# Altium schematic sheet Detection_Circuit.SchDoc
size 114 x 127 mm; SheetNumber: 2; SheetTotal: 3
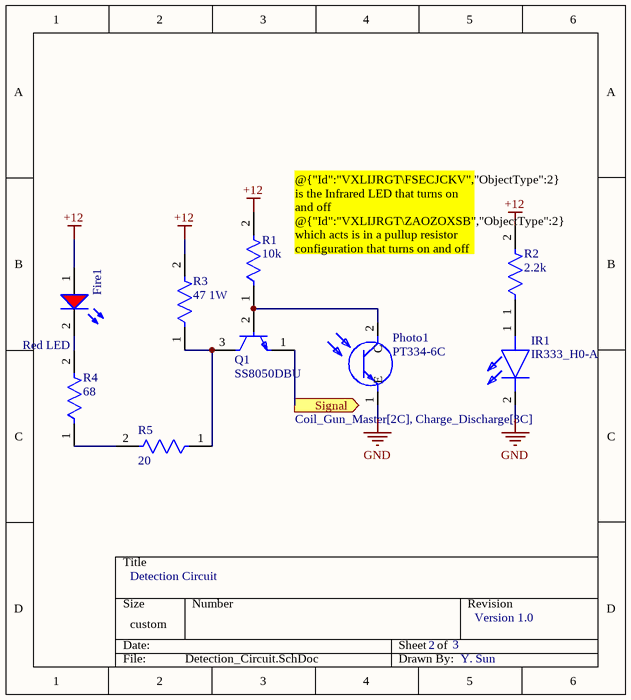
[diagram p0: Detection_Circuit.SchDoc]

## Parts
Fire1  Red LED  [WL-TMRC_D5.9H8.7]
IR1  IR333_H0-A  [IR333H0A]
Photo1  PT334-6C  [PT3346C]
Q1  SS8050DBU  [FP-135AN-MFG]
R1  10k  [FP-CFR16-MFG]
R2  2.2k  [FP-CFR16-MFG]
R3  47 1W  [FP-RR01-MFG]
R4  68  [FP-CFR16-MFG]
R5  20  [FP-CFR16-MFG]

## Ports
Signal (out, see Coil_Gun_Master[2C], Charge_Discharge[3C])

## Nets
+12: Fire1.1(A) R1.2 R2.2 R3.2
GND: IR1.2(K) Photo1.1(E)
Signal: Q1.1(E) ; port Signal
NetFire1_2: Fire1.2(K) R4.2
NetIR1_1: IR1.1(A) R2.1
NetPhoto1_2: Photo1.2(C) Q1.2(B) R1.1
NetQ1_3: Q1.3(C) R3.1 R5.1
NetR4_1: R4.1 R5.2

## Notes on the sheet
- @{"Id":"VXLIJRGT\FSECJCKV","ObjectType":2} is the Infrared LED that turns on and off @{"Id":"VXLIJRGT\ZAOZOXSB","ObjectType":2} which acts is in a pullup resistor configuration that turns on and off the transistor that controls the Thrysistor
- Detection Circuit
- 2
- 3
- Version 1.0
- Y. Sun

## Library data of the parts
Fire1 = CMP-1488-00008-3: WL-TMRC Red Color Diffused 5 mm Round Through Hole LED; Manufacturer Lifecycle Status: ACTIVE; Forward Voltage: 2.1V; YEOL: 1 = Estimated lifetime > 10 years; Lens Size: 5mm; Lens Style: Circular, Diffused, Round; Luminous Intensity: 30mcd; Test Current: 20mA; Viewing Angle: 60°; Wavelength: 630nm; Max Reverse Voltage (DC): 5V; Forward Current: 100mA; Dominant Wavelength: 645nm; Peak Wavelength: 650nm; Height: 8.6mm; REACH SVHC: Unknown; Width: 5mm; RoHS: Compliant; Mount: Through Hole; Case/Package: Radial; Min Operating Temperature: -40°C; Length: 5mm; Max Operating Temperature: 85°C; Packaging: Bulk; Color: Red; Lifecycle Status: Production
IR1 = IR333_H0-A: LED; Manufacturer_Name: Everlight; Manufacturer_Part_Number: IR333/H0-A; Datasheet Link: https://datasheet.lcsc.com/lcsc/1808280419_Everlight-Elec-IR333-H0-A_C264292.pdf; Height: 10.4mm; Mouser Part Number: 638-IR333/H0-A; Mouser Price/Stock: https://www.mouser.co.uk/ProductDetail/Everlight/IR333-H0-A?qs=By6Nw2ByBD39%252BlkBkN%2FobQ%3D%3D
Photo1 = PT334-6C: Phototransistor; Manufacturer_Name: Everlight; Datasheet Link: https://ar.mouser.com/datasheet/2/143/EVER_S_A0003541250_1-2548712.pdf; Height: 10.4mm; Manufacturer_Part_Number: PT334-6C; Mouser Part Number: 638-PT334-6C; Mouser Price/Stock: https://www.mouser.co.uk/ProductDetail/Everlight/PT334-6C?qs=1zthkiRbLn0w%252B4NEo66uDw%3D%3D; Arrow Part Number: PT334-6C; Arrow Price/Stock: https://www.arrow.com/en/products/pt334-6c/everlight-electronics?utm_currency=USD&region=nac
Q1 = CMP-00278-84331634-1: SS8050DBU Bipolar (BJT) Single Transistor, NPN, 25 V, 100 MHz, 1 W, 1.5 A, 160; Manufacturer Lifecycle Status: ACTIVE; Collector Base Voltage (VCBO): 40V; Power Dissipation: 1W; Max Junction Temperature (Tj): 150°C; Frequency: 100MHz; Output Power: 2W; Collector Emitter Voltage (VCEO): 25V; Max Collector Current: 1.5A; Collector Emitter Saturation Voltage: 500mV; Number of Elements: 1; Emitter Base Voltage (VEBO): 6V; hFE Min: 85; RoHS: Compliant; Lifecycle Status: Production; Lead Free: Lead Free; Transition Frequency: 100MHz; Case/Package: TO-92; Width: 3.86mm; Min Operating Temperature: -65°C; Element Configuration: Single; Gain Bandwidth Product: 100MHz; REACH SVHC: No SVHC; Max Frequency: 100MHz; Radiation Hardening: No; Current Rating: 1.5A; Mount: Through Hole; Max Operating Temperature: 150°C; Polarity: NPN; Number of Pins: 3; Collector Emitter Breakdown Voltage: 25V; Schedule B: 8541290080, 8541290080; Packaging: Bulk; Weight: 179mg; NexarPartId: 84331634; Voltage Rating (DC): 25V; Max Power Dissipation: 1W; Height: 4.58mm; Length: 4.58mm
R1 R2 R4 R5 = CMP-03212-000007-1: RES 120 OHM 1/4W 5% AXIAL; Resistance: 120R; Power Rating: 250mW; Number of Resistors: 1; Voltage Rating: 200V; Temperature Coefficient: 0ppm/°C; RoHS Compliant: Yes; Mount: Axial; Package Quantity: 5000; Diameter: 1.85mm; Number of Terminations: 2; Packaging: Cut Tape; Max Operating Temperature: 155°C; Resistance Tolerance: 5%; Termination: Axial; Length: 3.5mm; Max Power Dissipation: 250mW; Min Operating Temperature: -55°C; Resistor Type: Thin Film; Technology: CARBON FILM; Case/Package: Axial; Tolerance: 5%; Series: CFR16, Neohm; Voltage Rating (DC): 200V; ELV: Compliant; REACH SVHC: No SVHC
R3 = CMP-03212-000006-1: RES 100 OHM 5% 1W AXIAL; Temperature Coefficient: 300ppm/°C; Number of Resistors: 1; Resistance: 100R; Voltage Rating: 350V; Resistor Type: Power resistor; Mount: Axial; Power Rating: 1W; RoHS Compliant: Yes; Tolerance: 5%; Packaging: Ammo Pack; ELV: Compliant; Number of Terminations: 2; Case/Package: Axial